# Altium schematic sheet CAN.SchDoc
size A4; SheetNumber: 15; SheetTotal: 17
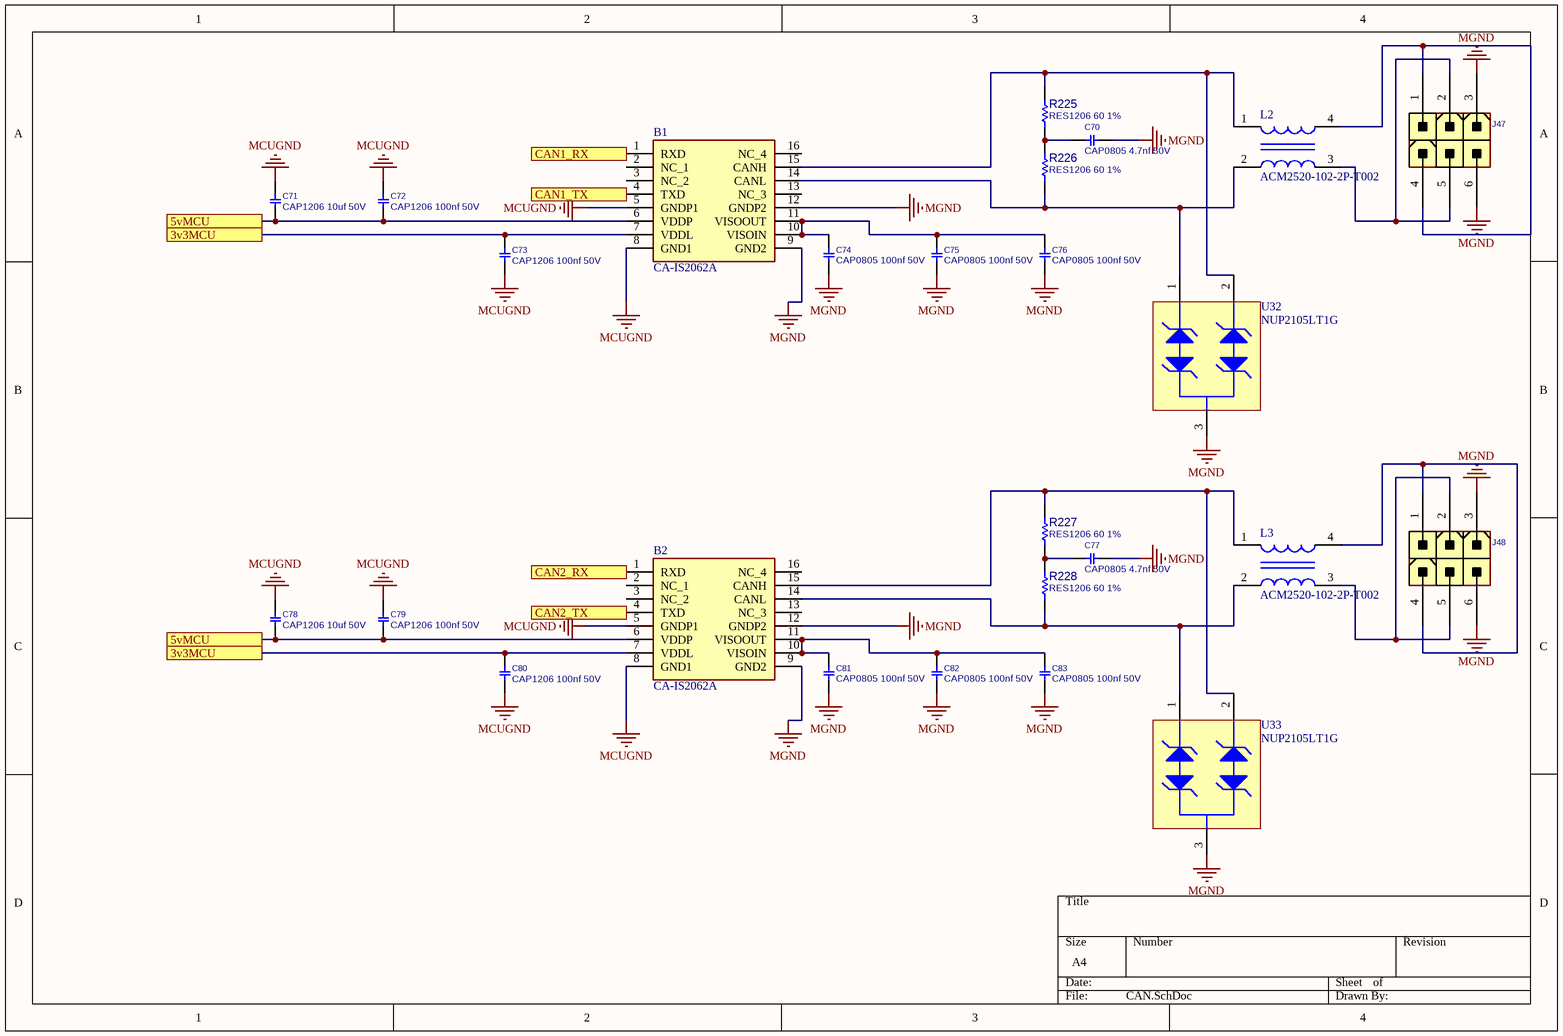
[diagram p0: CAN.SchDoc]

## Parts
B1  CA-IS2062A  [CAIS2062A]
B2  CA-IS2062A  [CAIS2062A]
C70  CAP0805 4.7nf 50V  [C0805]
C71  CAP1206 10uf 50V  [C1206]
C72  CAP1206 100nf 50V  [C1206]
C73  CAP1206 100nf 50V  [C1206]
C74  CAP0805 100nf 50V  [C0805]
C75  CAP0805 100nf 50V  [C0805]
C76  CAP0805 100nf 50V  [C0805]
C77  CAP0805 4.7nf 50V  [C0805]
C78  CAP1206 10uf 50V  [C1206]
C79  CAP1206 100nf 50V  [C1206]
C80  CAP1206 100nf 50V  [C1206]
C81  CAP0805 100nf 50V  [C0805]
C82  CAP0805 100nf 50V  [C0805]
C83  CAP0805 100nf 50V  [C0805]
J47  CONN_ATXPWR_6  [ATXPWR_6]  (value not drawn)
J48  CONN_ATXPWR_6  [ATXPWR_6]  (value not drawn)
L2  ACM2520-102-2P-T002  [FP-ACM2520-2P-MFG]
L3  ACM2520-102-2P-T002  [FP-ACM2520-2P-MFG]
R225  RES1206 60 1%  [R0805]
R226  RES1206 60 1%  [R0805]
R227  RES1206 60 1%  [R0805]
R228  RES1206 60 1%  [R0805]
U32  NUP2105LT1G  [PRKT-SOT23-3_V]
U33  NUP2105LT1G  [PRKT-SOT23-3_V]

## Ports
3v3MCU, 5vMCU, CAN1_RX, CAN1_TX, CAN2_RX, CAN2_TX

## Nets
MCUGND: B1.5(GNDP1) B1.8(GND1) B2.5(GNDP1) B2.8(GND1) C71.1 C72.1 C73.2 C78.1 C79.1 C80.2
MGND: B1.9(GND2) B1.12(GNDP2) B2.9(GND2) B2.12(GNDP2) C70.2 C74.1 C75.1 C76.1 C77.2 C81.1 C82.1 C83.1 J47.3 J47.6 J48.3 J48.6 U32.3 U33.3
3v3MCU: B1.7(VDDL) B2.7(VDDL) C73.1 C80.1 ; port 3v3MCU
5vMCU: B1.6(VDDP) B2.6(VDDP) C71.2 C72.2 C78.2 C79.2 ; port 5vMCU
CAN1_RX: B1.1(RXD) ; port CAN1_RX
CAN1_TX: B1.4(TXD) ; port CAN1_TX
CAN2_RX: B2.1(RXD) ; port CAN2_RX
CAN2_TX: B2.4(TXD) ; port CAN2_TX
NetB1_10: B1.10(VISOIN) B1.11(VISOOUT) C74.2 C75.2 C76.2
NetB1_14: B1.14(CANL) L2.2 R226.1 U32.1
NetB1_15: B1.15(CANH) L2.1 R225.2 U32.2
NetB2_10: B2.10(VISOIN) B2.11(VISOOUT) C81.2 C82.2 C83.2
NetB2_14: B2.14(CANL) L3.2 R228.1 U33.1
NetB2_15: B2.15(CANH) L3.1 R227.2 U33.2
NetC70_1: C70.1 R225.1 R226.2
NetC77_1: C77.1 R227.1 R228.2
NetJ47_1: J47.1 J47.4 L2.4
NetJ47_2: J47.2 J47.5 L2.3
NetJ48_1: J48.1 J48.4 L3.4
NetJ48_2: J48.2 J48.5 L3.3

Not connected (* = marked no-connect by the designer): B1 2(NC_1) 3(NC_2) 13(NC_3) 16(NC_4); B2 2(NC_1) 3(NC_2) 13(NC_3) 16(NC_4)

## Library data of the parts
B1 B2 = CA-IS2062A: LGA-16(4.7x5.2) Isolated CAN Transceivers (with Power) ROHS; Manufacturer_Name: ChipAnalog; Geometry.Height: 1.09mm; Manufacturer_Part_Number: CA-IS2062A; Mouser Part Number: *; Mouser Price/Stock: *; Arrow Part Number: *; Arrow Price/Stock: *; Datasheet Link: https://e.chipanalog.com/Public/Uploads/uploadfile/files/20250325/CAIS2062AdatasheetVersion1.01en20250325.pdf
C70 C74-C77 C81-C83 = CAP_SMD_MLCC_0805: CAP, MLCC; PARAM: -, -%; MANF_P#: MANF_PART#; PARAM2: -V; PRICE: 100= 1$; MANF: -; ASSEMBLY: ASSEMBLY
C71-C73 C78-C80 = CAP_SMD_MLCC_1206: CAP, MLCC; PARAM: -, -%; MANF_P#: MANF_PART#; PARAM2: -V; PRICE: 100= 1$; MANF: -; ASSEMBLY: ASSEMBLY
J47 J48 = CONN_ATXPWR_6: CONN, ATX POWER, 6 P; MANF: TE; MANF_P#: 4-1775099-1; VALUE: CONN_ATXPWR_6; MountType: THD; PACKAGE: ATXPWR-6pin; Part Type: Conn.
L2 L3 = CMP-08256-000009-1: CMC 200MA 2LN 1KOHM SMD; Number of Lines: 2; Impedance: 1kR; Test Frequency: 100MHz; DC Resistance (DCR): 900mR; Voltage Rating: 20V; Series: ACM; Lead Free: Lead Free; Height: 0.051inch; Length: 0.098inch; Max DC Current: 200mA; Depth: 2.2mm; Package Quantity: 1; Case/Package: 1008; Max Operating Temperature: 85°C; Termination: SMD/SMT; Min Operating Temperature: -40°C; Packaging: Tape and Reel; DC Current: 200mA; Current: 200mA; Mount: Surface Mount; Width: 0.079inch
R225-R228 = RES_SMD_0805: RESISTOR, SMD; PARAM: -W; DESC: DESCRIPTION; DIST#: MOUSER; MANF_P#: -; MANF: -; ASSEMBLY: ASSEMBLY; PRICE: 100= 0.5$; PARAM2: 1%
U32 U33 = CMP-2000-07553-1: TVS Array - Asymmetrical Data Line Protector, 600 W, 7.5 V, -55 to 150 degC, 3-Pin SOT23, RoHS, Tape and Reel; Manufacturer: Protek Devices; Min Breakdown Voltage: 7.5V; Direction: Bidirectional; Capacitance: 75pF; Current: 20uA; Power Dissipation: 600W; Working Voltage: 7V; Voltage: 12V; Case\/Package: SOT-23; Clamping Voltage: 17V; Element Configuration: Dual; Mounting Technology: SurfaceMount; RoHSCompliant: True; Radiation Hardening: No; Depth: 1.4mm; Lead Free: LeadFree; Package Description: 3-Pin Small Outline Transistor, Body 2.92 x 1.3 mm, Pitch 0.94 mm; Max Operating Temperature: 150degC; Length: 3.04mm; Manufacturer URL: http://www.protekdevices.com/; Min Operating Temperature: -55degC; Leakage Current: 20uA; Datasheet URL: www.protekdevices.com/xyz/documents/datasheets/psm712.pdf; Packaging: TapeandReel; Datasheet Version: 10/2013; Package Reference: SOT23-3; Number of Pins: 3